# Altium schematic sheet Esquematico.SchDoc
size A4; SheetNumber: 2; SheetTotal: 2
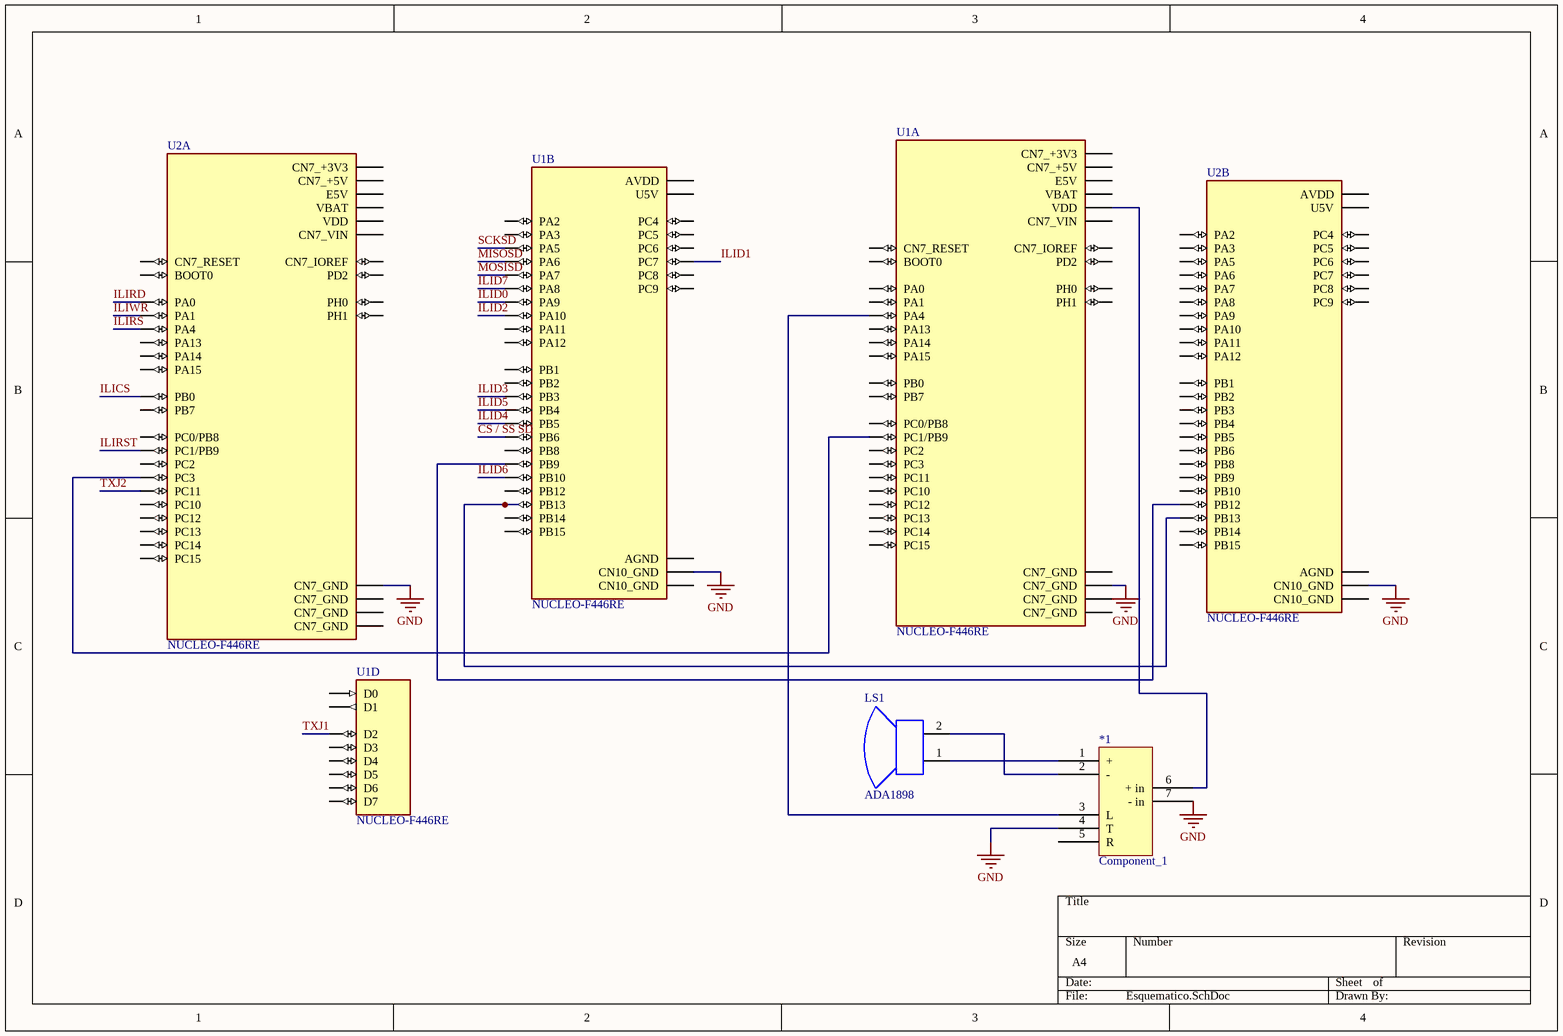
[diagram p0: Esquematico.SchDoc]

## Parts
*1  Component_1
LS1  ADA1898  [ADAI-ADA1898]
U1  NUCLEO-F446RE  [MODULE_NUCLEO-F446RE]  (parts A,B,D of 6)
U2  NUCLEO-F446RE  [MODULE_NUCLEO-F446RE]  (parts A,B of 6)

## Nets
GND: *1.4(T) *1.7(-_in) U1.CN7_19(CN7_GND) U1.CN10_9(CN10_GND) U2.CN7_8(CN7_GND) U2.CN10_9(CN10_GND)
CS / SS SD: U1.CN10_17(PB6)
ILICS: U2.CN7_34(PB0)
ILID0: U1.CN10_21(PA9)
ILID1: U1.CN10_19(PC7)
ILID2: U1.CN10_33(PA10)
ILID3: U1.CN10_31(PB3)
ILID4: U1.CN10_29(PB5)
ILID5: U1.CN10_27(PB4)
ILID6: U1.CN10_25(PB10)
ILID7: U1.CN10_23(PA8)
ILIRD: U2.CN7_28(PA0)
ILIRS: U2.CN7_32(PA4)
ILIRST: U2.CN7_36(PC1/PB9)
ILIWR: U2.CN7_30(PA1)
MISOSD: U1.CN10_13(PA6)
MOSISD: U1.CN10_15(PA7)
SCKSD: U1.CN10_11(PA5)
TXJ1: U1.CN9_3(D2)
TXJ2: U2.CN7_2(PC11)
Net*1_1: *1.1(+) LS1.1(+)
Net*1_2: *1.2(-) LS1.2(-)
Net*1_3: *1.3(L) U1.CN7_32(PA4)
Net*1_6: *1.6(+_in) U1.CN7_5(VDD)
NetU1_CN7_36: U1.CN7_36(PC1/PB9) U2.CN7_37(PC3)
NetU1_CN10_5: U1.CN10_5(PB9) U2.CN10_16(PB12)
NetU1_CN10_30: U1.CN10_30(PB13) U2.CN10_30(PB13)

Not connected (* = marked no-connect by the designer): *1 5(R); U1 CN7_1(PC10) CN7_2(PC11) CN7_3(PC12) CN7_4(PD2) CN7_6(E5V) CN7_7(BOOT0) CN7_8(CN7_GND) CN7_12(CN7_IOREF) CN7_13(PA13) CN7_14(CN7_RESET) CN7_15(PA14) CN7_16(CN7_+3V3) CN7_17(PA15) CN7_18(CN7_+5V) CN7_20(CN7_GND) CN7_21(PB7) CN7_22(CN7_GND) CN7_23(PC13) CN7_24(CN7_VIN) CN7_25(PC14) CN7_27(PC15) CN7_28(PA0) CN7_29(PH0) CN7_30(PA1) CN7_31(PH1) CN7_33(VBAT) CN7_34(PB0) CN7_35(PC2) CN7_37(PC3) CN7_38(PC0/PB8) CN9_1(D0) CN9_2(D1) CN9_4(D3) CN9_5(D4) CN9_6(D5) CN9_7(D6) CN9_8(D7) CN10_1(PC9) CN10_2(PC8) CN10_3(PB8) CN10_4(PC6) CN10_6(PC5) CN10_7(AVDD) CN10_8(U5V) CN10_12(PA12) CN10_14(PA11) CN10_16(PB12) CN10_20(CN10_GND) CN10_22(PB2) CN10_24(PB1) CN10_26(PB15) CN10_28(PB14) CN10_32(AGND) CN10_34(PC4) CN10_35(PA2) CN10_37(PA3); U2 CN7_1(PC10) CN7_3(PC12) CN7_4(PD2) CN7_5(VDD) CN7_6(E5V) CN7_7(BOOT0) CN7_12(CN7_IOREF) CN7_13(PA13) CN7_14(CN7_RESET) CN7_15(PA14) CN7_16(CN7_+3V3) CN7_17(PA15) CN7_18(CN7_+5V) CN7_19(CN7_GND) CN7_20(CN7_GND) CN7_21(PB7) CN7_22(CN7_GND) CN7_23(PC13) CN7_24(CN7_VIN) CN7_25(PC14) CN7_27(PC15) CN7_29(PH0) CN7_31(PH1) CN7_33(VBAT) CN7_35(PC2) CN7_38(PC0/PB8) CN10_1(PC9) CN10_2(PC8) CN10_3(PB8) CN10_4(PC6) CN10_5(PB9) CN10_6(PC5) CN10_7(AVDD) CN10_8(U5V) CN10_11(PA5) CN10_12(PA12) CN10_13(PA6) CN10_14(PA11) CN10_15(PA7) CN10_17(PB6) CN10_19(PC7) CN10_20(CN10_GND) CN10_21(PA9) CN10_22(PB2) CN10_23(PA8) CN10_24(PB1) CN10_25(PB10) CN10_26(PB15) CN10_27(PB4) CN10_28(PB14) CN10_29(PB5) CN10_31(PB3) CN10_32(AGND) CN10_33(PA10) CN10_34(PC4) CN10_35(PA2) CN10_37(PA3)

## Library data of the parts
LS1 = CMP-00027-00000-1: Mini Speaker, 8 Ohm, 0.2 Wmax, -10 to 40 degC, 2-Pin THD, RoHS; Manufacturer: Adafruit Industries; Mounting Technology: TH; Datasheet URL: https://cdn-shop.adafruit.com/datasheets/P1898.pdf; Package Description: 2-Pin Through Hole Device, Dia 29.3 mm, Pitch 15 mm; Case/Package: ADA1898; Package Reference: ADA1898; Datasheet Version: Mar-14; Manufacturer URL: https://www.adafruit.com/; RoHS Compliant: Unknown
U1 U2 = NUCLEO-F446RE: STM32F446RE, mbed-Enabled Development Nucleo-64 STM32F4 ARMÂ® CortexÂ®-M4 MCU 32-Bit Embedded Evaluation Board; MF: STMicroelectronics; SnapEDA_Link: https://www.snapeda.com/parts/NUCLEO-F446RE/STMicroelectronics/view-part/?ref=snap; Package: None; Value: *; MP: NUCLEO-F446RE; Check_prices: https://www.snapeda.com/parts/NUCLEO-F446RE/STMicroelectronics/view-part/?ref=eda